# Altium schematic sheet Buck_12V_to_5V_3A_TPS563201.SchDoc
size A; SheetNumber: 12; SheetTotal: 12
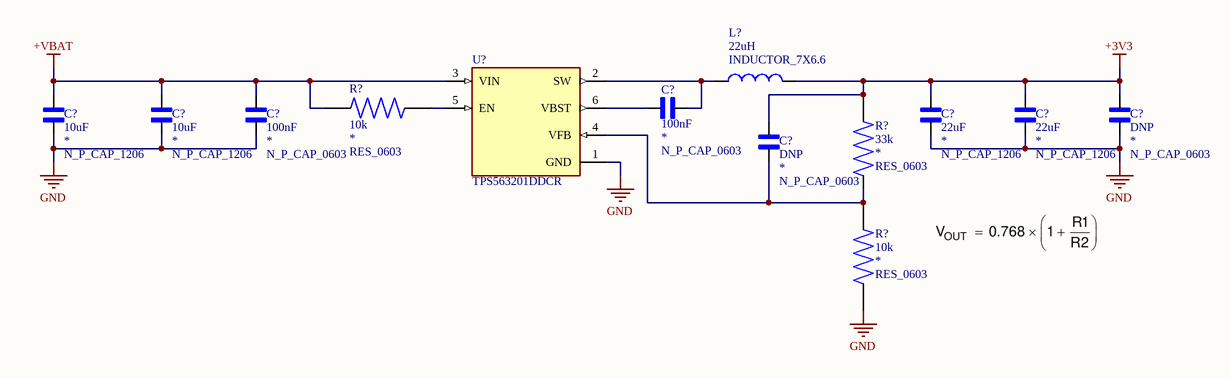
[diagram p0: Buck_12V_to_5V_3A_TPS563201.SchDoc]

## Parts
(Parts that share a designator on the sheet are numbered #1, #2 ... from top to bottom, then left to right.)
C?#1  N_P_CAP_0603  value 100nF  [N_P_CAP_0603]
C?#2  N_P_CAP_1206  value 10uF  [N_P_CAP_1206]
C?#3  N_P_CAP_1206  value 10uF  [N_P_CAP_1206]
C?#4  N_P_CAP_0603  value 100nF  [N_P_CAP_0603]
C?#5  N_P_CAP_1206  value 22uF  [N_P_CAP_1206]
C?#6  N_P_CAP_1206  value 22uF  [N_P_CAP_1206]
C?#7  N_P_CAP_0603  value DNP  [N_P_CAP_0603]
C?#8  N_P_CAP_0603  value DNP  [N_P_CAP_0603]
L?  INDUCTOR_7X6.6  value 22uH  [INDUCTOR_7X6.6]
R?#1  RES_0603  value 10k  [RES_0603]
R?#2  RES_0603  value 33k  [RES_0603]
R?#3  RES_0603  value 10k  [RES_0603]
U?  TPS563201DDCR  [SOT95P280X110-6N]

## Nets
+3V3: C?#5.2 C?#6.2 C?#7.2 C?#8.1 L?.2 R?#2.2
+VBAT: C?#2.2 C?#3.2 C?#4.2 R?#1.2 U?.3(VIN)
GND: C?#2.1 C?#3.1 C?#4.1 C?#5.1 C?#6.1 C?#7.1 R?#3.1 U?.1(GND)
NetC?#1_1: C?#1.1 L?.1 U?.2(SW)
NetC?#1_2: C?#1.2 U?.6(VBST)
NetC?#8_2: C?#8.2 R?#2.1 R?#3.2 U?.4(VFB)
NetR?#1_1: R?#1.1 U?.5(EN)

## Library data of the parts
C?#1-C?#8 = N_P_CAP: GENERIC NON-POLARIZED CAP; LCSC Part Number: *; Tolerance: *; MF: *; ESR: *; MPN: *; Temperature Coefficient: *; Rated Voltage: *
L? = INDUCTOR: GENERIC INDUCTOR; MF: *; LCSC Part Number: *; Irms: *; DCR (Max): *; Isat: *; MPN: *; Tolerance: *
R?#1-R?#3 = RES: GENERIC RES; Power Rating: *; MPN: *; Rated Voltage: *; Temperature Coefficient: *; LCSC Part Number: *; Tolerance: *
U? = TPS563201DDCR: 4.5 V to 17 V input, 3 A output, synchronous step-down converter in Eco-mode; MF: Texas Instruments; Package: SOT-23-THN-6 Texas Instruments; MPN: TPS563201DDCR